# Altium project Phaser.PrjPCB (part 5 of 11)

## Sheet FPGA_Config.SchDoc: =DocumentName
size A4; DocumentNumber: 1; Revision: 0; SheetNumber: 1; SheetTotal: 1
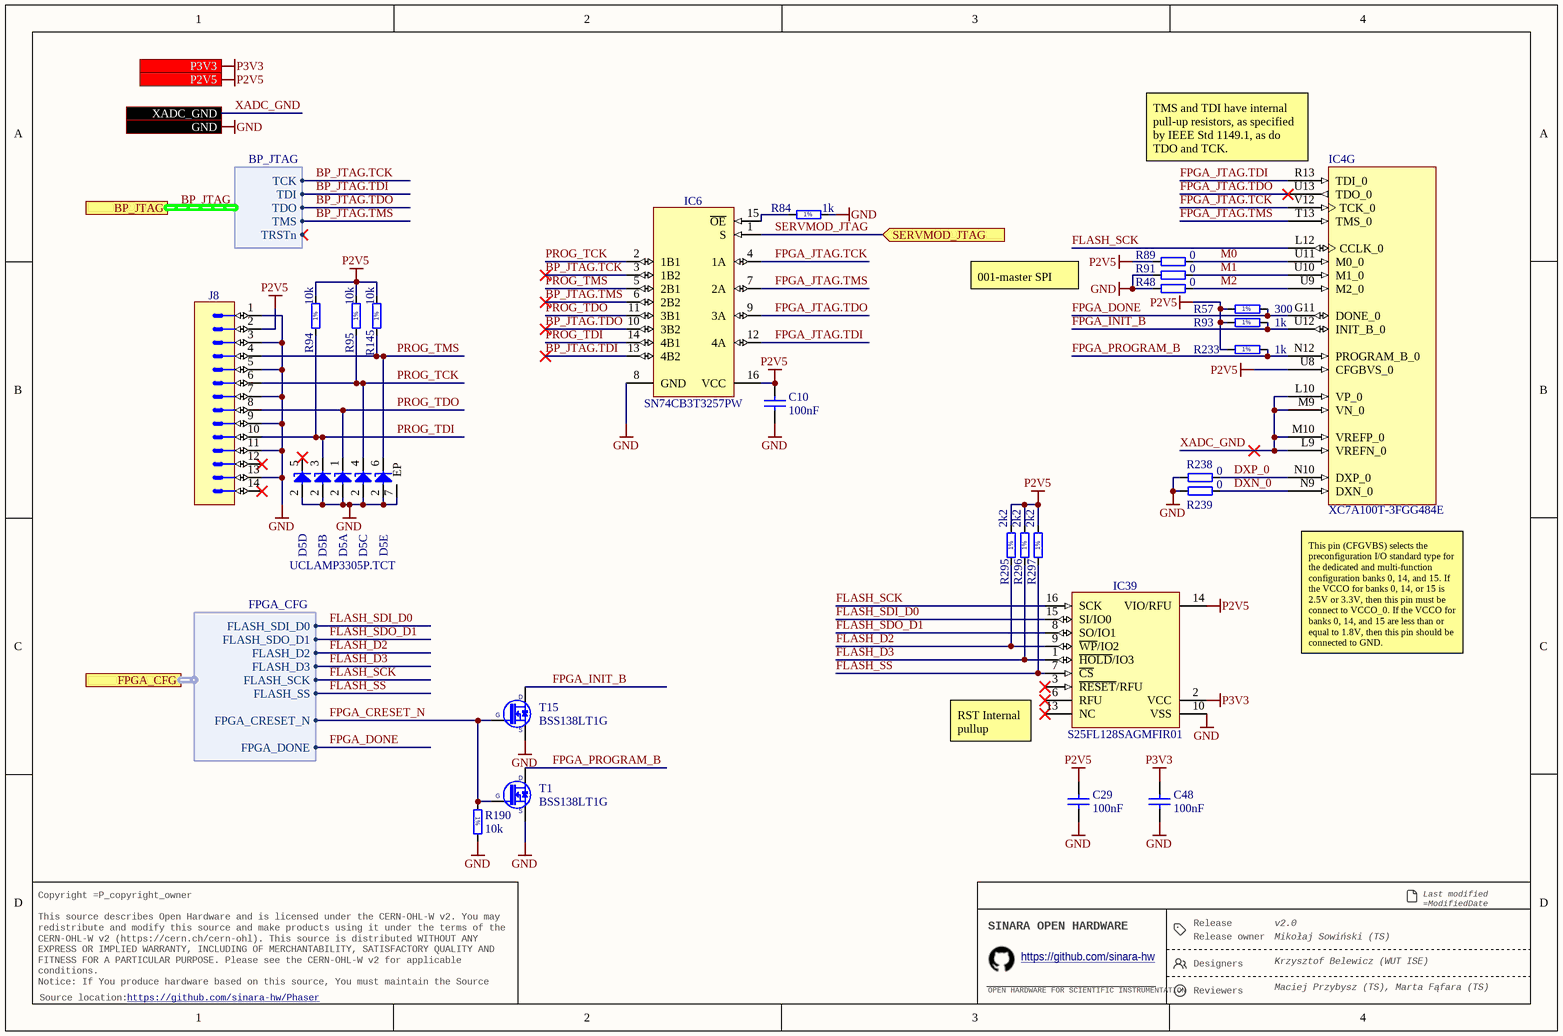
[diagram p14: FPGA_Config.SchDoc]

### Parts
(Parts that share a designator on the sheet are numbered #1, #2 ... from top to bottom, then left to right.)
C10  100nF  [CAPC1005X55N]
C29  100nF  [CAPC1005X55N]
C48  100nF  [CAPC1005X55N]
D5  UCLAMP3305P.TCT  [SON50P160X65_HS-7N]  (value not drawn)  (parts A,B,C,D,E of 5)
IC4#1  XC7A100T-3FGG484E  [FGG484]  (part G of 10)
IC6  SN74CB3T3257PW  [SOP65P640X120-16N]
IC39  S25FL128SAGMFIR01  [SOIC127P1030X265-16N]
J8  Milli-Grid™  [MOLEX_87832-1420]  (value not drawn)
R48  0  [RESC1005X40N]
R57  300  [RESC1005X40N]
R84  1k  [RESC1005X40N]
R89  0  [RESC1005X40N]
R91  0  [RESC1005X40N]
R93  1k  [RESC1005X40N]
R94  10k  [RESC1005X40N]
R95  10k  [RESC1005X40N]
R145  10k  [RESC1005X40N]
R190  10k  [RESC1005X40N]
R233  1k  [RESC1005X40N]
R238  0  [RESC1005X40N]
R239  0  [RESC1005X40N]
R295  2k2  [RESC1005X40N]
R296  2k2  [RESC1005X40N]
R297  2k2  [RESC1005X40N]
T1  BSS138LT1G  [SOT95P240X110-3N]
T15  BSS138LT1G  [SOT95P240X110-3N]

### Ports
BP_JTAG (harness BP_JTAG), FPGA_CFG (harness FPGA_CFG), GND, P2V5 (in), P3V3 (in), SERVMOD_JTAG (in), XADC_GND

### Harnesses
FPGA_CFG: FLASH_SDI_D0, FLASH_SDO_D1, FLASH_D2, FLASH_D3, FLASH_SCK, FLASH_SS, FPGA_CRESET_N, FPGA_DONE
BP_JTAG: TCK, TDI, TDO, TMS, TRSTn

### Nets
GND: C10.1 C29.1 C48.1 D5.2(A) D5.7(EP) IC6.8(GND) IC39.10(VSS) J8.1 J8.3 J8.5 J8.7 J8.9 J8.11 J8.13 R48.1 R84.2 R91.1 R190.2 R238.1 R239.1 T1.2(S) T15.2(S) ; port GND
P2V5: C10.2 C29.2 IC4#1.U8(CFGBVS_0) IC6.16(VCC) IC39.14(VIO/RFU) J8.2 R57.1 R89.1 R93.2 R94.2 R95.2 R145.2 R233.2 R295.2 R296.2 R297.2 ; port P2V5
P3V3: C48.2 IC39.2(VCC) ; port P3V3
BP_JTAG.TCK: IC6.3(1B2) ; port BP_JTAG.TCK
BP_JTAG.TDI: IC6.13(4B2) ; port BP_JTAG.TDI
BP_JTAG.TDO: IC6.10(3B2) ; port BP_JTAG.TDO
BP_JTAG.TMS: IC6.6(2B2) ; port BP_JTAG.TMS
DXN_0: IC4#1.N9(DXN_0) R239.2
DXP_0: IC4#1.N10(DXP_0) R238.2
FLASH_D2: IC39.9(~{WP}/IO2) R295.1 ; port FPGA_CFG.FLASH_D2  [project net FPGA_CFG.FLASH_D2]
FLASH_D3: IC39.1(~{HOLD}/IO3) R296.1 ; port FPGA_CFG.FLASH_D3  [project net FPGA_CFG.FLASH_D3]
FLASH_SCK: IC4#1.L12(CCLK_0) IC39.16(SCK) ; port FPGA_CFG.FLASH_SCK  [project net FPGA_CFG.FLASH_SCK]
FLASH_SDI_D0: IC39.15(SI/IO0) ; port FPGA_CFG.FLASH_SDI_D0  [project net FPGA_CFG.FLASH_SDI_D0]
FLASH_SDO_D1: IC39.8(SO/IO1) ; port FPGA_CFG.FLASH_SDO_D1  [project net FPGA_CFG.FLASH_SDO_D1]
FLASH_SS: IC39.7(~{CS}) R297.1 ; port FPGA_CFG.FLASH_SS  [project net FPGA_CFG.FLASH_SS]
FPGA_CRESET_N: R190.1 T1.1(G) T15.1(G) ; port FPGA_CFG.FPGA_CRESET_N  [project net FPGA_CFG.FPGA_CRESET_N]
FPGA_DONE: IC4#1.G11(DONE_0) R57.2 ; port FPGA_CFG.FPGA_DONE  [project net FPGA_CFG.FPGA_DONE]
FPGA_INIT_B: IC4#1.U12(INIT_B_0) R93.1 T15.3(D)
FPGA_JTAG.TCK: IC4#1.V12(TCK_0) IC6.4(1A)
FPGA_JTAG.TDI: IC4#1.R13(TDI_0) IC6.12(4A)
FPGA_JTAG.TDO: IC4#1.U13(TDO_0) IC6.9(3A)
FPGA_JTAG.TMS: IC4#1.T13(TMS_0) IC6.7(2A)
FPGA_PROGRAM_B: IC4#1.N12(PROGRAM_B_0) R233.1 T1.3(D)
M0: IC4#1.U11(M0_0) R89.2
M1: IC4#1.U10(M1_0) R91.2
M2: IC4#1.U9(M2_0) R48.2
PROG_TCK: D5.4(C) IC6.2(1B1) J8.6 R95.1
PROG_TDI: D5.3(C) IC6.14(4B1) J8.10 R94.1
PROG_TDO: D5.1(C) IC6.11(3B1) J8.8
PROG_TMS: D5.6(C) IC6.5(2B1) J8.4 R145.1
SERVMOD_JTAG: IC6.1(S) ; port SERVMOD_JTAG
XADC_GND: IC4#1.L9(VREFN_0) IC4#1.L10(VP_0) IC4#1.M9(VN_0) IC4#1.M10(VREFP_0) ; port XADC_GND
NetIC6_15: IC6.15(~{OE}) R84.1

Not connected (* = marked no-connect by the designer): D5 5(C)*; IC39 3(~{RESET}/RFU)* 6(RFU)* 13(NC)*; J8 12* 14*

### Buses and harness runs
harness BP_JTAG = port BP_JTAG

### Notes on the sheet
- (near IC4#1) TMS and TDI have internal pull-up resistors, as specified by IEEE Std 1149.1, as do TDO and TCK.
- 001-master SPI
- (near IC4#1) This pin (CFGVBS) selects the preconfiguration I/O standard type for the dedicated and multi-function configuration banks 0, 14, and 15. If the VCCO for banks 0, 14, or 15 is 2.5V or 3.3V, then this pin must be connect to VCCO_0. If the VCCO for banks 0, 14, and 15 are less than or equal to 1.8V, then this pin should be connected to GND.
- (near IC39) RST Internal pullup
- Release
- Last modified =ModifiedDate
  Sheet =sheetnumber of =sheettotal · Size A4
- Copyright =P_copyright_owner
  This source describes Open Hardware and is licensed under the CERN-OHL-W v2. You may redistribute and modify this source and make products using it under the terms of the CERN-OHL-W v2 (https://cern.ch/cern-ohl). This source is distributed WITHOUT ANY EXPRESS OR IMPLIED WARRANTY, INCLUDING OF MERCHANTABILITY, SATISFACTORY QUALITY AND FITNESS FOR A PARTICULAR PURPOSE. Please see the CERN-OHL-W v2 for applicable conditions.
  Notice: If You produce hardware based on this source, You must maintain the Source Location visible on the product, its packaging or its documentation.
- SINARA OPEN HARDWARE
- OPEN HARDWARE FOR SCIENTIFIC INSTRUMENTATION
- https://github.com/sinara-hw
- Release owner
- Designers
- Reviewers
- Source location:
- (in symbol R0402_1K_1%_0.0625W_100PPM) 1%
- (in symbol R0402_2K2_1%_0.0625W_100PPM) 1%
- (in symbol R0402_10K_1%_0.0625W_100PPM) 1%
- (in symbol R0402_300R_1%_0.0625W_100PPM) 1%

### Library data of the parts
C10 C29 C48 = CC0402_100NF_50V_10%_X7R: Non-polarised capacitor; Part Description: SMD Multilayer Chip Ceramic Capacitor; Manufacturer: GENERIC; Manufacturer1 Part Number: GRM155R71H104KE14D; Voltage: 50V; TC: X7R; Tolerance: ±10%; Part Number: CC0402_100NF_50V_10%_X7R; Component Kind: Standard; Component Type: Standard; Pin Count: 2; Value: 100nF; Status: None; Manufacturer Part Number: CC0402_100NF_50V_10%_X7R; Case: 0402; Mounted: Yes; Socket: No; SMD: Yes; Sense: No; Manufacturer1 Example: MURATA; Manufacturer1 ComponentHeight: 0.55mm; HelpURL: \\cern.ch\dfs\Applications\Altium\Datasheets\CC0402_MURATA_GRM155R71H104KE14D.pdf; Author: CERN DEM MR; CreateDate: 30.06.2017; LatestRevisionDate: 30.06.2017
D5 = CMP-004-00037-2: Diode TVS Quint Common Anode Uni-Dir 3.3V 40W 6-Pin SLP EP T/R; Max Operating Temperature: 125°C; Min Operating Temperature: -55°C; Pins: 6; Mounting Technology: Surface Mount
IC4#1 = CMP-0364-00028-3: Artix-7 FPGA, 285 User I/Os, 4 GTP, 484-Ball BGA, Speed Grade 3, Extended Grade, Pb-Free; Manufacturer: Xilinx; Max User I/O: 300; Clock Mgmt Tiles (CMTs): 6; Logic Cells: 101440; Block RAM Blocks (36Kb): 135; Block RAM Blocks (18Kb): 270; Speed Grade: -3; CLBs (Slices): 15850; Block RAM Blocks (Max Kb): 4860; DSP48E1 Slices: 240; RoHS: Pb-Free; ComponentLink3URL: http://www.xilinx.com/support/documentation/data_sheets/ds181_Artix_7_Data_Sheet.pdf; NexusDeviceID: XC7A100T-3FGG484E; DatasheetVersion: v1.12; Mounting Technology: Surface Mount; PackageDescription: Wire-Bond Fine-Pitch BGA, Body 23 x 23 mm, 1.0 mm Pitch; PackageReference: FGG484; ComponentLink2Description: Package Specification; Code_JEDEC: MS-034-AAJ-1; ComponentLink2URL: http://www.xilinx.com/support/documentation/user_guides/ug475_7Series_Pkg_Pinout.pdf; ComponentLink3Description: DC and Switching Characteristics; Generic Part Number: XC7A100T; ComponentLink4Description: Package File; ComponentLink4URL: http://www.xilinx.com/support/packagefiles/a7packages/xc7a100tfgg484pkg.txt; ComponentLink1URL: http://www.xilinx.com/support/documentation/data_sheets/ds180_7Series_Overview.pdf; PartNumber: XC7A100T-3FGG484E; ComponentLink5URL: http://www.xilinx.com/support/documentation/user_guides/ug475_7Series_Pkg_Pinout.pdf; PackageVersion: Rev 1.8; ComponentLink5Description: Packaging and Pinout; ComponentLink1Description: Datasheet; CLBs (Max Distributed RAM Kb): 1188
IC6 = SN74CB3T3257PW: 4-BIT 1-OF-2 FET Multiplexer/Demultiplexer 2.5V/3.3V Low-Voltage Bus Switch 5V Tolerant Shifter; Manufacturer: TEXAS INSTRUMENTS; PressFit: No; Bonding: No; Part Number: SN74CB3T3257PW; Component Kind: Standard; Component Type: Standard; Device: SN74CB3T3257PW; PackageDescription: SOP, 0.65mm Pitch; 16 Pin, 4.40mm W X 5.00mm L X 1.20mm H body, IPC Medium Density; Part Description: 4-Bit 1-of-2 FET Multiplexer/Demultiplexer 2.5V/3.3V Low-Voltage Bus Switch 5V Tolerant Shifter; Manufacturer Part Number: SN74CB3T3257PW; Pin Count: 16; Case: TSSOP16; Mounted: Yes; Socket: No; SMD: Yes; Sense: No; ComponentHeight: 1.2mm; Author: CERN DEM JLC; HelpURL: \\cern.ch\dfs\Applications\Altium\Datasheets\SN74CB3T3257PW.pdf; CreateDate: 2012-01-30; LatestRevisionDate: 2012-01-30
IC39 = S25FL128SAGMFIR01: 128Mbit, MirrorBit® Flash Non-Volatile Memory CMOS 3.0 Volt Core with Versatile I/O Serial Peripheral Interface with Multi-I/O; Part Description: 128Mbit, 133MHz, MirrorBit® Flash Non-Volatile Memory CMOS 3V Core with Versatile I/O Serial Peripheral Interface with Multi-I/O; Manufacturer: SPANSION; PressFit: No; Bonding: No; Part Number: S25FL128SAGMFIR01; Component Kind: Standard; Component Type: Standard; Device: S25FL128SAGMFIR01; PackageDescription: SOIC 16, Pitch 1.27mm - Body 7.5x10.3mm, IPC Medium Density; Manufacturer Part Number: S25FL128SAGMFIR01; Pin Count: 11; Case: SOIC16; Mounted: Yes; Socket: No; SMD: Yes; Sense: No; ComponentHeight: 2.65mm; HelpURL: \\cern.ch\dfs\Applications\Altium\Datasheets\S25FL128SAGMFIR01.pdf; Author: CERN DEM JLC; CreateDate: 2014-07-10; LatestRevisionDate: 2014-07-10
J8 = MOLEX_87832-1420: Connector 14 Male; Part Description: 2.00mm (.079") Pitch Milli-Grid™ Header, Surface Mount, Vertical, Shrouded, 14 Circuits,with Locking Windows and Centre Polarization Slot, PCB Locator; Manufacturer: MOLEX; PressFit: No; Part Number: MOLEX_87832-1420; Component Kind: Standard; Component Type: Standard; Pin Count: 14; Family: Milli-Grid™; Mounted: Yes; Socket: No; SMD: Yes; Sense: No; Status: None; Manufacturer Part Number: 87832-1420; ComponentHeight: 7.6mm; HelpURL: \\cern.ch\dfs\Applications\Altium\Datasheets\MOLEX_87832-1420.pdf; Author: CERN DEM JLC; CreateDate: 09.09.2008; LatestRevisionDate: 09.09.2008
R48 R89 R91 R238 R239 = R0402_0R_JUMPER: Resistor; Part Description: 1A (0.05R Max DC Resistance) Zero Ohm Jumper; Manufacturer: GENERIC; Manufacturer1 Part Number: 232270591001L; PressFit: No; Part Number: R0402_0R_JUMPER; Component Kind: Standard; Component Type: Standard; Pin Count: 2; Value: 0; Status: Not Recommended; Manufacturer Part Number: R0402_0R_JUMPER; Case: 0402; Mounted: Yes; Sense: No; Socket: No; SMD: Yes; Manufacturer1 Example: YAGEO PHYCOMP; Manufacturer1 ComponentHeight: 0.4mm; HelpURL: \\cern.ch\dfs\Applications\Altium\Datasheets\R0402_Phycomp_RC0402.pdf; Author: CERN DEM JLC; CreateDate: 03.12.2007; LatestRevisionDate: 17.10.2012; ClassName: Artix
R57 = R0402_300R_1%_0.0625W_100PPM: Resistor - 1%; Part Description: General Purpose Thick Film Chip Resistor; Manufacturer: GENERIC; Manufacturer1 Part Number: 232270673001L; TC: ±100ppm/°C; PressFit: No; Part Number: R0402_300R_1%_0.0625W_100PPM; Component Kind: Standard; Component Type: Standard; Pin Count: 2; Value: 300; Status: Not Recommended; Power: 0.0625W; Tolerance: ±1%; Manufacturer Part Number: R0402_300R_1%_0.0625W_100PPM; Case: 0402; Mounted: Yes; Sense: No; Socket: No; SMD: Yes; Manufacturer1 Example: YAGEO PHYCOMP; Manufacturer1 ComponentHeight: 0.4mm; HelpURL: \\cern.ch\dfs\Applications\Altium\Datasheets\R0402_Phycomp_RC0402.pdf; Author: CERN DEM JLC; CreateDate: 03.12.2007; LatestRevisionDate: 17.10.2012
R84 R93 R233 = R0402_1K_1%_0.0625W_100PPM: Resistor - 1%; Part Description: General Purpose Thick Film Chip Resistor; Manufacturer: GENERIC; Manufacturer1 Part Number: 232270671002L; TC: ±100ppm/°C; PressFit: No; Part Number: R0402_1K_1%_0.0625W_100PPM; Component Kind: Standard; Component Type: Standard; Pin Count: 2; Value: 1k; Status: Not Recommended; Power: 0.0625W; Tolerance: ±1%; Manufacturer Part Number: R0402_1K_1%_0.0625W_100PPM; Case: 0402; Mounted: Yes; Sense: No; Socket: No; SMD: Yes; Manufacturer1 Example: YAGEO PHYCOMP; Manufacturer1 ComponentHeight: 0.4mm; HelpURL: \\cern.ch\dfs\Applications\Altium\Datasheets\R0402_Phycomp_RC0402.pdf; Author: CERN DEM JLC
  R84: CreateDate: 2007-12-03; LatestRevisionDate: 2012-10-17
  R93 R233: CreateDate: 03.12.2007; LatestRevisionDate: 17.10.2012; ClassName: Artix
R94 R95 R145 = R0402_10K_1%_0.0625W_100PPM: Resistor - 1%; Part Description: General Purpose Thick Film Chip Resistor; Manufacturer: GENERIC; Manufacturer1 Part Number: 232270671003L; TC: ±100ppm/°C; PressFit: No; Part Number: R0402_10K_1%_0.0625W_100PPM; Component Kind: Standard; Component Type: Standard; Pin Count: 2; Value: 10k; Status: Not Recommended; Power: 0.0625W; Tolerance: ±1%; Manufacturer Part Number: R0402_10K_1%_0.0625W_100PPM; Case: 0402; Mounted: Yes; Sense: No; Socket: No; SMD: Yes; Manufacturer1 Example: YAGEO PHYCOMP; Manufacturer1 ComponentHeight: 0.4mm; HelpURL: \\cern.ch\dfs\Applications\Altium\Datasheets\R0402_Phycomp_RC0402.pdf; Author: CERN DEM JLC; CreateDate: 2007-12-03; LatestRevisionDate: 2012-10-17
R190 = R0402_10K_1%_0.0625W_100PPM: Resistor - 1%; Part Description: General Purpose Thick Film Chip Resistor; Manufacturer: GENERIC; Manufacturer1 Part Number: 232270671003L; TC: ±100ppm/°C; Table: Resistors SMD; Part Number: R0402_10K_1%_0.0625W_100PPM; Component Kind: Standard; Component Type: Standard; Pin Count: 2; Value: 10k; Status: Not recommended; Power: 0.0625W; Tolerance: ±1%; Manufacturer Part Number: R0402_10K_1%_0.0625W_100PPM; Case: 0402; Mounted: Yes; Socket: No; SMD: Yes; Manufacturer1 Example: YAGEO PHYCOMP; Manufacturer1 ComponentHeight: 0.4mm; HelpURL: \\cern.ch\dfs\Applications\Altium\Datasheets\R0402_Phycomp_RC0402.pdf; Author: CERN DEM JLC; CreateDate: 2007-12-03; LatestRevisionDate: 2012-10-17
R295-R297 = R0402_2K2_1%_0.0625W_100PPM: Resistor - 1%; Part Description: General Purpose Thick Film Chip Resistor; Manufacturer: GENERIC; Manufacturer1 Part Number: 232270672202L; TC: ±100ppm/°C; PressFit: No; Part Number: R0402_2K2_1%_0.0625W_100PPM; Component Kind: Standard; Component Type: Standard; Pin Count: 2; Value: 2k2; Status: Not Recommended; Power: 0.0625W; Tolerance: ±1%; Manufacturer Part Number: R0402_2K2_1%_0.0625W_100PPM; Case: 0402; Mounted: Yes; Sense: No; Socket: No; SMD: Yes; Manufacturer1 Example: YAGEO PHYCOMP; Manufacturer1 ComponentHeight: 0.4mm; HelpURL: \\cern.ch\dfs\Applications\Altium\Datasheets\R0402_Phycomp_RC0402.pdf; Author: CERN DEM JLC; CreateDate: 03.12.2007; LatestRevisionDate: 17.10.2012; ClassName: Artix
T1 T15 = BSS138LT1G: N-CHANNEL MOSFET WITH DIODE; Part Description: 50V 200mA N-Channel Enhancement Mode Field-Effect Transistor; Manufacturer: ON SEMICONDUCTOR; PressFit: No; Bonding: No; Part Number: BSS138LT1G; Component Kind: Standard; Component Type: Standard; Device: BSS138LT1G; PackageDescription: SOT23 3-Leads, Pitch 0.95mm - Body 1.4x3mm, IPC Medium Density; Manufacturer Part Number: BSS138LT1G; Pin Count: 3; Case: SOT23-3; Mounted: Yes; Socket: No; SMD: Yes; Sense: No; ComponentHeight: 1.11mm; HelpURL: \\cern.ch\dfs\Applications\Altium\Datasheets\BSS138LT1G.pdf; Author: CERN DEM JLC; CreateDate: 23.03.2009; LatestRevisionDate: 23.03.2009

## Sheet FPGA_Bank34.SchDoc: =DocumentName
size A3; DocumentNumber: 1; Revision: 0; SheetNumber: 1; SheetTotal: 1
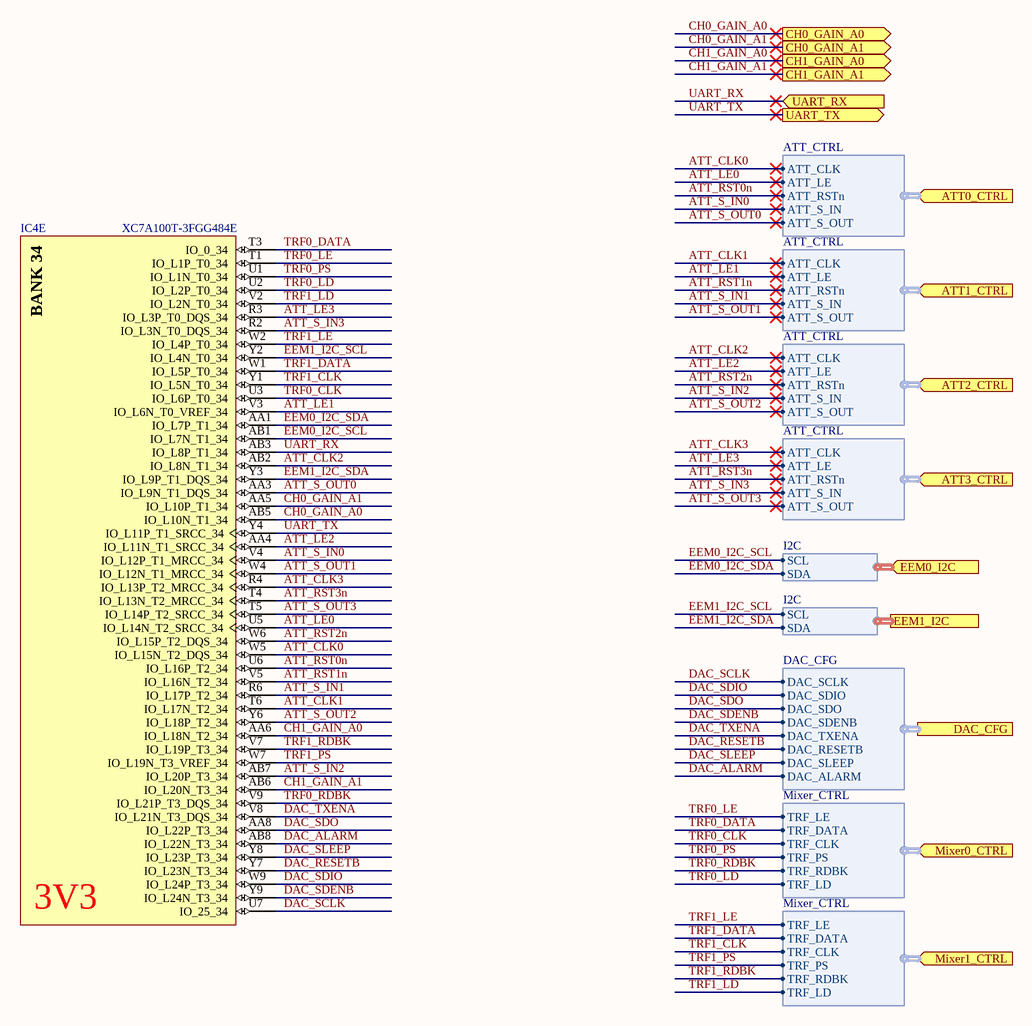
[diagram p15: FPGA_Bank34.SchDoc]

### Parts
(Parts that share a designator on the sheet are numbered #1, #2 ... from top to bottom, then left to right.)
IC4#1  XC7A100T-3FGG484E  [FGG484]  (part E of 10)

### Ports
ATT0_CTRL (in, harness ATT_CTRL), ATT1_CTRL (in, harness ATT_CTRL), ATT2_CTRL (in, harness ATT_CTRL), ATT3_CTRL (in, harness ATT_CTRL), CH0_GAIN_A0 (out), CH0_GAIN_A1 (out), CH1_GAIN_A0 (out), CH1_GAIN_A1 (out), DAC_CFG (harness DAC_CFG), EEM0_I2C (in, harness I2C), EEM1_I2C (harness I2C), Mixer0_CTRL (in, harness Mixer_CTRL), Mixer1_CTRL (in, harness Mixer_CTRL), UART_RX (in), UART_TX (out)

### Harnesses
I2C: SDA, SCL
DAC_CFG: DAC_SCLK, DAC_SDIO, DAC_SDO, DAC_SDENB, DAC_TXENA, DAC_RESETB, DAC_SLEEP, DAC_ALARM
Mixer_CTRL: TRF_LE, TRF_DATA, TRF_CLK, TRF_PS, TRF_RDBK, TRF_LD
ATT_CTRL: ATT_CLK, ATT_LE, ATT_RSTn, ATT_S_IN, ATT_S_OUT

### Nets
ATT_CLK0: IC4#1.W5(IO_L15N_T2_DQS_34) ; port ATT0_CTRL.ATT_CLK
ATT_CLK1: IC4#1.T6(IO_L17N_T2_34) ; port ATT1_CTRL.ATT_CLK
ATT_CLK2: IC4#1.AB2(IO_L8N_T1_34) ; port ATT2_CTRL.ATT_CLK
ATT_CLK3: IC4#1.R4(IO_L13P_T2_MRCC_34) ; port ATT3_CTRL.ATT_CLK
ATT_LE0: IC4#1.U5(IO_L14N_T2_SRCC_34) ; port ATT0_CTRL.ATT_LE
ATT_LE1: IC4#1.V3(IO_L6N_T0_VREF_34) ; port ATT1_CTRL.ATT_LE
ATT_LE2: IC4#1.AA4(IO_L11N_T1_SRCC_34) ; port ATT2_CTRL.ATT_LE
ATT_LE3: IC4#1.R3(IO_L3P_T0_DQS_34) ; port ATT3_CTRL.ATT_LE
ATT_RST0n: IC4#1.U6(IO_L16P_T2_34) ; port ATT0_CTRL.ATT_RSTn
ATT_RST1n: IC4#1.V5(IO_L16N_T2_34) ; port ATT1_CTRL.ATT_RSTn
ATT_RST2n: IC4#1.W6(IO_L15P_T2_DQS_34) ; port ATT2_CTRL.ATT_RSTn
ATT_RST3n: IC4#1.T4(IO_L13N_T2_MRCC_34) ; port ATT3_CTRL.ATT_RSTn
ATT_S_IN0: IC4#1.V4(IO_L12P_T1_MRCC_34) ; port ATT0_CTRL.ATT_S_IN
ATT_S_IN1: IC4#1.R6(IO_L17P_T2_34) ; port ATT1_CTRL.ATT_S_IN
ATT_S_IN2: IC4#1.AB7(IO_L20P_T3_34) ; port ATT2_CTRL.ATT_S_IN
ATT_S_IN3: IC4#1.R2(IO_L3N_T0_DQS_34) ; port ATT3_CTRL.ATT_S_IN
ATT_S_OUT0: IC4#1.AA3(IO_L9N_T1_DQS_34) ; port ATT0_CTRL.ATT_S_OUT
ATT_S_OUT1: IC4#1.W4(IO_L12N_T1_MRCC_34) ; port ATT1_CTRL.ATT_S_OUT
ATT_S_OUT2: IC4#1.Y6(IO_L18P_T2_34) ; port ATT2_CTRL.ATT_S_OUT
ATT_S_OUT3: IC4#1.T5(IO_L14P_T2_SRCC_34) ; port ATT3_CTRL.ATT_S_OUT
CH0_GAIN_A0: IC4#1.AB5(IO_L10N_T1_34) ; port CH0_GAIN_A0
CH0_GAIN_A1: IC4#1.AA5(IO_L10P_T1_34) ; port CH0_GAIN_A1
CH1_GAIN_A0: IC4#1.AA6(IO_L18N_T2_34) ; port CH1_GAIN_A0
CH1_GAIN_A1: IC4#1.AB6(IO_L20N_T3_34) ; port CH1_GAIN_A1
DAC_ALARM: IC4#1.AB8(IO_L22N_T3_34) ; port DAC_CFG.DAC_ALARM
DAC_RESETB: IC4#1.Y7(IO_L23N_T3_34) ; port DAC_CFG.DAC_RESETB
DAC_SCLK: IC4#1.U7(IO_25_34) ; port DAC_CFG.DAC_SCLK
DAC_SDENB: IC4#1.Y9(IO_L24N_T3_34) ; port DAC_CFG.DAC_SDENB
DAC_SDIO: IC4#1.W9(IO_L24P_T3_34) ; port DAC_CFG.DAC_SDIO
DAC_SDO: IC4#1.AA8(IO_L22P_T3_34) ; port DAC_CFG.DAC_SDO
DAC_SLEEP: IC4#1.Y8(IO_L23P_T3_34) ; port DAC_CFG.DAC_SLEEP
DAC_TXENA: IC4#1.V8(IO_L21N_T3_DQS_34) ; port DAC_CFG.DAC_TXENA
EEM0_I2C_SCL: IC4#1.AB1(IO_L7N_T1_34) ; port EEM0_I2C.SCL  [project net EEM0_INT_I2C.SCL]
EEM0_I2C_SDA: IC4#1.AA1(IO_L7P_T1_34) ; port EEM0_I2C.SDA  [project net EEM0_INT_I2C.SDA]
EEM1_I2C_SCL: IC4#1.Y2(IO_L4N_T0_34) ; port EEM1_I2C.SCL  [project net EEM1_INT_I2C.SCL]
EEM1_I2C_SDA: IC4#1.Y3(IO_L9P_T1_DQS_34) ; port EEM1_I2C.SDA  [project net EEM1_INT_I2C.SDA]
TRF0_CLK: IC4#1.U3(IO_L6P_T0_34) ; port Mixer0_CTRL.TRF_CLK  [project net TRF_CLK]
TRF0_DATA: IC4#1.T3(IO_0_34) ; port Mixer0_CTRL.TRF_DATA  [project net TRF_DATA]
TRF0_LD: IC4#1.U2(IO_L2P_T0_34) ; port Mixer0_CTRL.TRF_LD  [project net TRF_LD]
TRF0_LE: IC4#1.T1(IO_L1P_T0_34) ; port Mixer0_CTRL.TRF_LE  [project net TRF_LE]
TRF0_PS: IC4#1.U1(IO_L1N_T0_34) ; port Mixer0_CTRL.TRF_PS  [project net TRF_PS]
TRF0_RDBK: IC4#1.V9(IO_L21P_T3_DQS_34) ; port Mixer0_CTRL.TRF_RDBK  [project net TRF_RDBK]
TRF1_CLK: IC4#1.Y1(IO_L5N_T0_34) ; port Mixer1_CTRL.TRF_CLK  [project net TRF_CLK]
TRF1_DATA: IC4#1.W1(IO_L5P_T0_34) ; port Mixer1_CTRL.TRF_DATA  [project net TRF_DATA]
TRF1_LD: IC4#1.V2(IO_L2N_T0_34) ; port Mixer1_CTRL.TRF_LD  [project net TRF_LD]
TRF1_LE: IC4#1.W2(IO_L4P_T0_34) ; port Mixer1_CTRL.TRF_LE  [project net TRF_LE]
TRF1_PS: IC4#1.W7(IO_L19N_T3_VREF_34) ; port Mixer1_CTRL.TRF_PS  [project net TRF_PS]
TRF1_RDBK: IC4#1.V7(IO_L19P_T3_34) ; port Mixer1_CTRL.TRF_RDBK  [project net TRF_RDBK]
UART_RX: IC4#1.AB3(IO_L8P_T1_34) ; port UART_RX
UART_TX: IC4#1.Y4(IO_L11P_T1_SRCC_34) ; port UART_TX

### Notes on the sheet
- 3V3
- Release
- Last modified =ModifiedDate
  Sheet =sheetnumber of =sheettotal · Size A3
- Copyright =P_copyright_owner
  This source describes Open Hardware and is licensed under the CERN-OHL-W v2. You may redistribute and modify this source and make products using it under the terms of the CERN-OHL-W v2 (https://cern.ch/cern-ohl). This source is distributed WITHOUT ANY EXPRESS OR IMPLIED WARRANTY, INCLUDING OF MERCHANTABILITY, SATISFACTORY QUALITY AND FITNESS FOR A PARTICULAR PURPOSE. Please see the CERN-OHL-W v2 for applicable conditions.
  Notice: If You produce hardware based on this source, You must maintain the Source Location visible on the product, its packaging or its documentation.
- SINARA OPEN HARDWARE
- OPEN HARDWARE FOR SCIENTIFIC INSTRUMENTATION
- https://github.com/sinara-hw
- Release owner
- Designers
- Reviewers
- Source location:
- (in symbol CMP-0364-00028-3, part E) BANK 34

### Library data of the parts
IC4#1 = CMP-0364-00028-3: as IC4#1 on sheet FPGA_Config; RoHS: Pb-Free; ComponentLink3URL: http://www.xilinx.com/support/documentation/data_sheets/ds181_Artix_7_Data_Sheet.pdf; NexusDeviceID: XC7A100T-3FGG484E; DatasheetVersion: v1.12; Mounting Technology: Surface Mount; PackageDescription: Wire-Bond Fine-Pitch BGA, Body 23 x 23 mm, 1.0 mm Pitch; PackageReference: FGG484; ComponentLink2Description: Package Specification; Code_JEDEC: MS-034-AAJ-1; ComponentLink2URL: http://www.xilinx.com/support/documentation/user_guides/ug475_7Series_Pkg_Pinout.pdf; ComponentLink3Description: DC and Switching Characteristics; Generic Part Number: XC7A100T; ComponentLink4Description: Package File; ComponentLink4URL: http://www.xilinx.com/support/packagefiles/a7packages/xc7a100tfgg484pkg.txt; ComponentLink1URL: http://www.xilinx.com/support/documentation/data_sheets/ds180_7Series_Overview.pdf; PartNumber: XC7A100T-3FGG484E; ComponentLink5URL: http://www.xilinx.com/support/documentation/user_guides/ug475_7Series_Pkg_Pinout.pdf; PackageVersion: Rev 1.8; ComponentLink5Description: Packaging and Pinout; ComponentLink1Description: Datasheet; CLBs (Max Distributed RAM Kb): 1188

## Sheet FPGA_Bank15-16.SchDoc: =DocumentName
size A3; DocumentNumber: 1; Revision: 0; SheetNumber: 1; SheetTotal: 1
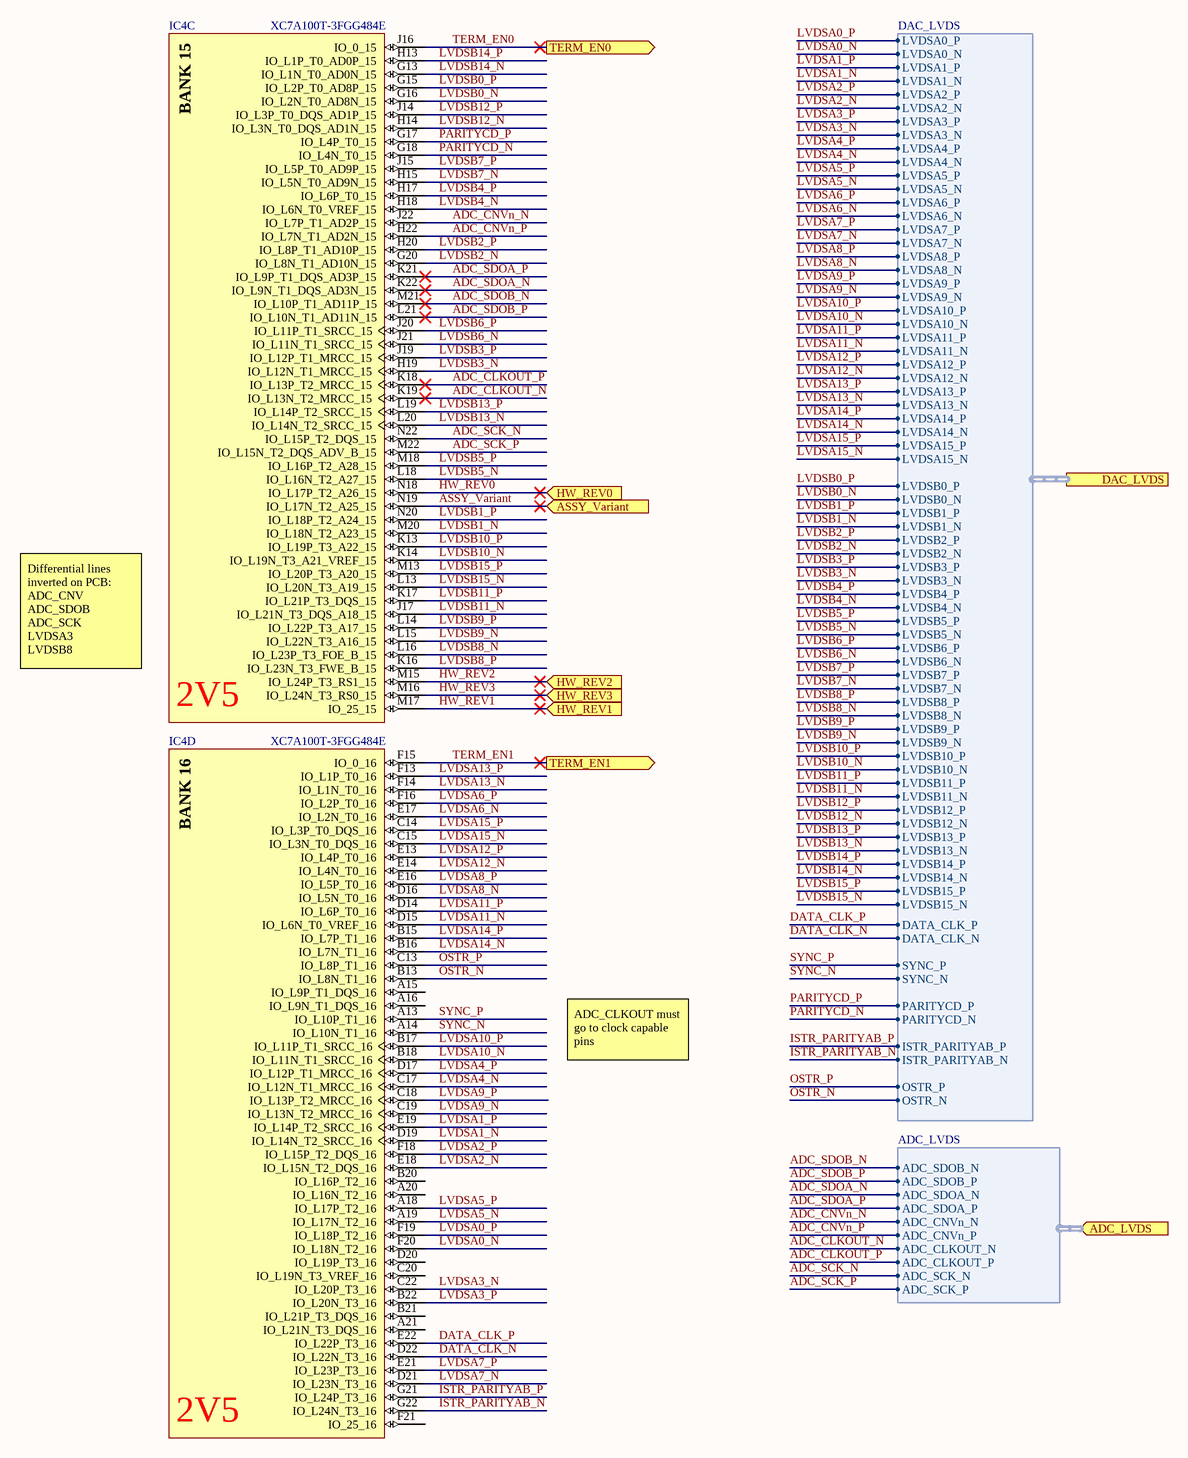
[diagram p16: FPGA_Bank15-16.SchDoc]

### Parts
(Parts that share a designator on the sheet are numbered #1, #2 ... from top to bottom, then left to right.)
IC4#1  XC7A100T-3FGG484E  [FGG484]  (parts C,D of 10)

### Ports
ADC_LVDS (in, harness ADC_LVDS), ASSY_Variant (in), DAC_LVDS (harness DAC_LVDS), HW_REV0 (in), HW_REV1 (in), HW_REV2 (in), HW_REV3 (in), TERM_EN0 (out), TERM_EN1 (out)

### Harnesses
DAC_LVDS: LVDSA0_P, LVDSA0_N, LVDSA1_P, LVDSA1_N, LVDSA2_P, LVDSA2_N, LVDSA3_P, LVDSA3_N, LVDSA4_P, LVDSA4_N, LVDSA5_P, LVDSA5_N, LVDSA6_P, LVDSA6_N, LVDSA7_P, LVDSA7_N, LVDSA8_P, LVDSA8_N, LVDSA9_P, LVDSA9_N, LVDSA10_P, LVDSA10_N, LVDSA11_P, LVDSA11_N, LVDSA12_P, LVDSA12_N, LVDSA13_P, LVDSA13_N, LVDSA14_P, LVDSA14_N, LVDSA15_P, LVDSA15_N, LVDSB0_P, LVDSB0_N, LVDSB1_P, LVDSB1_N, LVDSB2_P, LVDSB2_N, LVDSB3_P, LVDSB3_N, LVDSB4_P, LVDSB4_N, LVDSB5_P, LVDSB5_N, LVDSB6_P, LVDSB6_N, LVDSB7_P, LVDSB7_N, LVDSB8_P, LVDSB8_N, LVDSB9_P, LVDSB9_N, LVDSB10_P, LVDSB10_N, LVDSB11_P, LVDSB11_N, LVDSB12_P, LVDSB12_N, LVDSB13_P, LVDSB13_N, LVDSB14_P, LVDSB14_N, LVDSB15_P, LVDSB15_N, DATA_CLK_P, DATA_CLK_N, SYNC_P, SYNC_N, PARITYCD_P, PARITYCD_N, ISTR_PARITYAB_P, ISTR_PARITYAB_N, OSTR_P, OSTR_N
ADC_LVDS: ADC_SDOB_N, ADC_SDOB_P, ADC_SDOA_N, ADC_SDOA_P, ADC_CNVn_N, ADC_CNVn_P, ADC_CLKOUT_N, ADC_CLKOUT_P, ADC_SCK_N, ADC_SCK_P

### Nets
ADC_CLKOUT_N: IC4#1.K19(IO_L13N_T2_MRCC_15) ; port ADC_LVDS.ADC_CLKOUT_N
ADC_CLKOUT_P: IC4#1.K18(IO_L13P_T2_MRCC_15) ; port ADC_LVDS.ADC_CLKOUT_P
ADC_CNVn_N: IC4#1.J22(IO_L7P_T1_AD2P_15) ; port ADC_LVDS.ADC_CNVn_N
ADC_CNVn_P: IC4#1.H22(IO_L7N_T1_AD2N_15) ; port ADC_LVDS.ADC_CNVn_P
ADC_SCK_N: IC4#1.N22(IO_L15P_T2_DQS_15) ; port ADC_LVDS.ADC_SCK_N
ADC_SCK_P: IC4#1.M22(IO_L15N_T2_DQS_ADV_B_15) ; port ADC_LVDS.ADC_SCK_P
ADC_SDOA_N: IC4#1.K22(IO_L9N_T1_DQS_AD3N_15) ; port ADC_LVDS.ADC_SDOA_N
ADC_SDOA_P: IC4#1.K21(IO_L9P_T1_DQS_AD3P_15) ; port ADC_LVDS.ADC_SDOA_P
ADC_SDOB_N: IC4#1.M21(IO_L10P_T1_AD11P_15) ; port ADC_LVDS.ADC_SDOB_N
ADC_SDOB_P: IC4#1.L21(IO_L10N_T1_AD11N_15) ; port ADC_LVDS.ADC_SDOB_P
ASSY_Variant: IC4#1.N19(IO_L17N_T2_A25_15) ; port ASSY_Variant
DATA_CLK_N: IC4#1.D22(IO_L22N_T3_16) ; port DAC_LVDS.DATA_CLK_N
DATA_CLK_P: IC4#1.E22(IO_L22P_T3_16) ; port DAC_LVDS.DATA_CLK_P
HW_REV0: IC4#1.N18(IO_L17P_T2_A26_15) ; port HW_REV0
HW_REV1: IC4#1.M17(IO_25_15) ; port HW_REV1
HW_REV2: IC4#1.M15(IO_L24P_T3_RS1_15) ; port HW_REV2
HW_REV3: IC4#1.M16(IO_L24N_T3_RS0_15) ; port HW_REV3
ISTR_PARITYAB_N: IC4#1.G22(IO_L24N_T3_16) ; port DAC_LVDS.ISTR_PARITYAB_N
ISTR_PARITYAB_P: IC4#1.G21(IO_L24P_T3_16) ; port DAC_LVDS.ISTR_PARITYAB_P
LVDSA0_N: IC4#1.F20(IO_L18N_T2_16) ; port DAC_LVDS.LVDSA0_N
LVDSA0_P: IC4#1.F19(IO_L18P_T2_16) ; port DAC_LVDS.LVDSA0_P
LVDSA1_N: IC4#1.D19(IO_L14N_T2_SRCC_16) ; port DAC_LVDS.LVDSA1_N
LVDSA1_P: IC4#1.E19(IO_L14P_T2_SRCC_16) ; port DAC_LVDS.LVDSA1_P
LVDSA2_N: IC4#1.E18(IO_L15N_T2_DQS_16) ; port DAC_LVDS.LVDSA2_N
LVDSA2_P: IC4#1.F18(IO_L15P_T2_DQS_16) ; port DAC_LVDS.LVDSA2_P
LVDSA3_N: IC4#1.C22(IO_L20P_T3_16) ; port DAC_LVDS.LVDSA3_N
LVDSA3_P: IC4#1.B22(IO_L20N_T3_16) ; port DAC_LVDS.LVDSA3_P
LVDSA4_N: IC4#1.C17(IO_L12N_T1_MRCC_16) ; port DAC_LVDS.LVDSA4_N
LVDSA4_P: IC4#1.D17(IO_L12P_T1_MRCC_16) ; port DAC_LVDS.LVDSA4_P
LVDSA5_N: IC4#1.A19(IO_L17N_T2_16) ; port DAC_LVDS.LVDSA5_N
LVDSA5_P: IC4#1.A18(IO_L17P_T2_16) ; port DAC_LVDS.LVDSA5_P
LVDSA6_N: IC4#1.E17(IO_L2N_T0_16) ; port DAC_LVDS.LVDSA6_N
LVDSA6_P: IC4#1.F16(IO_L2P_T0_16) ; port DAC_LVDS.LVDSA6_P
LVDSA7_N: IC4#1.D21(IO_L23N_T3_16) ; port DAC_LVDS.LVDSA7_N
LVDSA7_P: IC4#1.E21(IO_L23P_T3_16) ; port DAC_LVDS.LVDSA7_P
LVDSA8_N: IC4#1.D16(IO_L5N_T0_16) ; port DAC_LVDS.LVDSA8_N
LVDSA8_P: IC4#1.E16(IO_L5P_T0_16) ; port DAC_LVDS.LVDSA8_P
LVDSA9_N: IC4#1.C19(IO_L13N_T2_MRCC_16) ; port DAC_LVDS.LVDSA9_N
LVDSA9_P: IC4#1.C18(IO_L13P_T2_MRCC_16) ; port DAC_LVDS.LVDSA9_P
LVDSA10_N: IC4#1.B18(IO_L11N_T1_SRCC_16) ; port DAC_LVDS.LVDSA10_N
LVDSA10_P: IC4#1.B17(IO_L11P_T1_SRCC_16) ; port DAC_LVDS.LVDSA10_P
LVDSA11_N: IC4#1.D15(IO_L6N_T0_VREF_16) ; port DAC_LVDS.LVDSA11_N
LVDSA11_P: IC4#1.D14(IO_L6P_T0_16) ; port DAC_LVDS.LVDSA11_P
LVDSA12_N: IC4#1.E14(IO_L4N_T0_16) ; port DAC_LVDS.LVDSA12_N
LVDSA12_P: IC4#1.E13(IO_L4P_T0_16) ; port DAC_LVDS.LVDSA12_P
LVDSA13_N: IC4#1.F14(IO_L1N_T0_16) ; port DAC_LVDS.LVDSA13_N
LVDSA13_P: IC4#1.F13(IO_L1P_T0_16) ; port DAC_LVDS.LVDSA13_P
LVDSA14_N: IC4#1.B16(IO_L7N_T1_16) ; port DAC_LVDS.LVDSA14_N
LVDSA14_P: IC4#1.B15(IO_L7P_T1_16) ; port DAC_LVDS.LVDSA14_P
LVDSA15_N: IC4#1.C15(IO_L3N_T0_DQS_16) ; port DAC_LVDS.LVDSA15_N
LVDSA15_P: IC4#1.C14(IO_L3P_T0_DQS_16) ; port DAC_LVDS.LVDSA15_P
LVDSB0_N: IC4#1.G16(IO_L2N_T0_AD8N_15) ; port DAC_LVDS.LVDSB0_N
LVDSB0_P: IC4#1.G15(IO_L2P_T0_AD8P_15) ; port DAC_LVDS.LVDSB0_P
LVDSB1_N: IC4#1.M20(IO_L18N_T2_A23_15) ; port DAC_LVDS.LVDSB1_N
LVDSB1_P: IC4#1.N20(IO_L18P_T2_A24_15) ; port DAC_LVDS.LVDSB1_P
LVDSB2_N: IC4#1.G20(IO_L8N_T1_AD10N_15) ; port DAC_LVDS.LVDSB2_N
LVDSB2_P: IC4#1.H20(IO_L8P_T1_AD10P_15) ; port DAC_LVDS.LVDSB2_P
LVDSB3_N: IC4#1.H19(IO_L12N_T1_MRCC_15) ; port DAC_LVDS.LVDSB3_N
LVDSB3_P: IC4#1.J19(IO_L12P_T1_MRCC_15) ; port DAC_LVDS.LVDSB3_P
LVDSB4_N: IC4#1.H18(IO_L6N_T0_VREF_15) ; port DAC_LVDS.LVDSB4_N
LVDSB4_P: IC4#1.H17(IO_L6P_T0_15) ; port DAC_LVDS.LVDSB4_P
LVDSB5_N: IC4#1.L18(IO_L16N_T2_A27_15) ; port DAC_LVDS.LVDSB5_N
LVDSB5_P: IC4#1.M18(IO_L16P_T2_A28_15) ; port DAC_LVDS.LVDSB5_P
LVDSB6_N: IC4#1.J21(IO_L11N_T1_SRCC_15) ; port DAC_LVDS.LVDSB6_N
LVDSB6_P: IC4#1.J20(IO_L11P_T1_SRCC_15) ; port DAC_LVDS.LVDSB6_P
LVDSB7_N: IC4#1.H15(IO_L5N_T0_AD9N_15) ; port DAC_LVDS.LVDSB7_N
LVDSB7_P: IC4#1.J15(IO_L5P_T0_AD9P_15) ; port DAC_LVDS.LVDSB7_P
LVDSB8_N: IC4#1.L16(IO_L23P_T3_FOE_B_15) ; port DAC_LVDS.LVDSB8_N
LVDSB8_P: IC4#1.K16(IO_L23N_T3_FWE_B_15) ; port DAC_LVDS.LVDSB8_P
LVDSB9_N: IC4#1.L15(IO_L22N_T3_A16_15) ; port DAC_LVDS.LVDSB9_N
LVDSB9_P: IC4#1.L14(IO_L22P_T3_A17_15) ; port DAC_LVDS.LVDSB9_P
LVDSB10_N: IC4#1.K14(IO_L19N_T3_A21_VREF_15) ; port DAC_LVDS.LVDSB10_N
LVDSB10_P: IC4#1.K13(IO_L19P_T3_A22_15) ; port DAC_LVDS.LVDSB10_P
LVDSB11_N: IC4#1.J17(IO_L21N_T3_DQS_A18_15) ; port DAC_LVDS.LVDSB11_N
LVDSB11_P: IC4#1.K17(IO_L21P_T3_DQS_15) ; port DAC_LVDS.LVDSB11_P
LVDSB12_N: IC4#1.H14(IO_L3N_T0_DQS_AD1N_15) ; port DAC_LVDS.LVDSB12_N
LVDSB12_P: IC4#1.J14(IO_L3P_T0_DQS_AD1P_15) ; port DAC_LVDS.LVDSB12_P
LVDSB13_N: IC4#1.L20(IO_L14N_T2_SRCC_15) ; port DAC_LVDS.LVDSB13_N
LVDSB13_P: IC4#1.L19(IO_L14P_T2_SRCC_15) ; port DAC_LVDS.LVDSB13_P
LVDSB14_N: IC4#1.G13(IO_L1N_T0_AD0N_15) ; port DAC_LVDS.LVDSB14_N
LVDSB14_P: IC4#1.H13(IO_L1P_T0_AD0P_15) ; port DAC_LVDS.LVDSB14_P
LVDSB15_N: IC4#1.L13(IO_L20N_T3_A19_15) ; port DAC_LVDS.LVDSB15_N
LVDSB15_P: IC4#1.M13(IO_L20P_T3_A20_15) ; port DAC_LVDS.LVDSB15_P
OSTR_N: IC4#1.B13(IO_L8N_T1_16) ; port DAC_LVDS.OSTR_N
OSTR_P: IC4#1.C13(IO_L8P_T1_16) ; port DAC_LVDS.OSTR_P
PARITYCD_N: IC4#1.G18(IO_L4N_T0_15) ; port DAC_LVDS.PARITYCD_N
PARITYCD_P: IC4#1.G17(IO_L4P_T0_15) ; port DAC_LVDS.PARITYCD_P
SYNC_N: IC4#1.A14(IO_L10N_T1_16) ; port DAC_LVDS.SYNC_N
SYNC_P: IC4#1.A13(IO_L10P_T1_16) ; port DAC_LVDS.SYNC_P
TERM_EN0: IC4#1.J16(IO_0_15) ; port TERM_EN0
TERM_EN1: IC4#1.F15(IO_0_16) ; port TERM_EN1

Not connected (* = marked no-connect by the designer): IC4#1 A15(IO_L9P_T1_DQS_16) A16(IO_L9N_T1_DQS_16) A20(IO_L16N_T2_16) A21(IO_L21N_T3_DQS_16) B20(IO_L16P_T2_16) B21(IO_L21P_T3_DQS_16) C20(IO_L19N_T3_VREF_16) D20(IO_L19P_T3_16) F21(IO_25_16)

### Notes on the sheet
- Differential lines inverted on PCB:
  ADC_CNV
  ADC_SDOB
  ADC_SCK
  LVDSA3
  LVDSB8
- 2V5
- ADC_CLKOUT must go to clock capable pins
- Release
- Last modified =ModifiedDate
  Sheet =sheetnumber of =sheettotal · Size A3
- Copyright =P_copyright_owner
  This source describes Open Hardware and is licensed under the CERN-OHL-W v2. You may redistribute and modify this source and make products using it under the terms of the CERN-OHL-W v2 (https://cern.ch/cern-ohl). This source is distributed WITHOUT ANY EXPRESS OR IMPLIED WARRANTY, INCLUDING OF MERCHANTABILITY, SATISFACTORY QUALITY AND FITNESS FOR A PARTICULAR PURPOSE. Please see the CERN-OHL-W v2 for applicable conditions.
  Notice: If You produce hardware based on this source, You must maintain the Source Location visible on the product, its packaging or its documentation.
- SINARA OPEN HARDWARE
- OPEN HARDWARE FOR SCIENTIFIC INSTRUMENTATION
- https://github.com/sinara-hw
- Release owner
- Designers
- Reviewers
- Source location:
- (in symbol CMP-0364-00028-3, part C) BANK 15
- (in symbol CMP-0364-00028-3, part D) BANK 16

### Library data of the parts
IC4#1 = CMP-0364-00028-3: as IC4#1 on sheet FPGA_Config; RoHS: Pb-Free; ComponentLink3URL: http://www.xilinx.com/support/documentation/data_sheets/ds181_Artix_7_Data_Sheet.pdf; NexusDeviceID: XC7A100T-3FGG484E; DatasheetVersion: v1.12; Mounting Technology: Surface Mount; PackageDescription: Wire-Bond Fine-Pitch BGA, Body 23 x 23 mm, 1.0 mm Pitch; PackageReference: FGG484; ComponentLink2Description: Package Specification; Code_JEDEC: MS-034-AAJ-1; ComponentLink2URL: http://www.xilinx.com/support/documentation/user_guides/ug475_7Series_Pkg_Pinout.pdf; ComponentLink3Description: DC and Switching Characteristics; Generic Part Number: XC7A100T; ComponentLink4Description: Package File; ComponentLink4URL: http://www.xilinx.com/support/packagefiles/a7packages/xc7a100tfgg484pkg.txt; ComponentLink1URL: http://www.xilinx.com/support/documentation/data_sheets/ds180_7Series_Overview.pdf; PartNumber: XC7A100T-3FGG484E; ComponentLink5URL: http://www.xilinx.com/support/documentation/user_guides/ug475_7Series_Pkg_Pinout.pdf; PackageVersion: Rev 1.8; ComponentLink5Description: Packaging and Pinout; ComponentLink1Description: Datasheet; CLBs (Max Distributed RAM Kb): 1188

## Sheet FPGA_SDRAM.SchDoc: =DocumentName
size A3; DocumentNumber: 1; Revision: 0; SheetNumber: 22; SheetTotal: 30
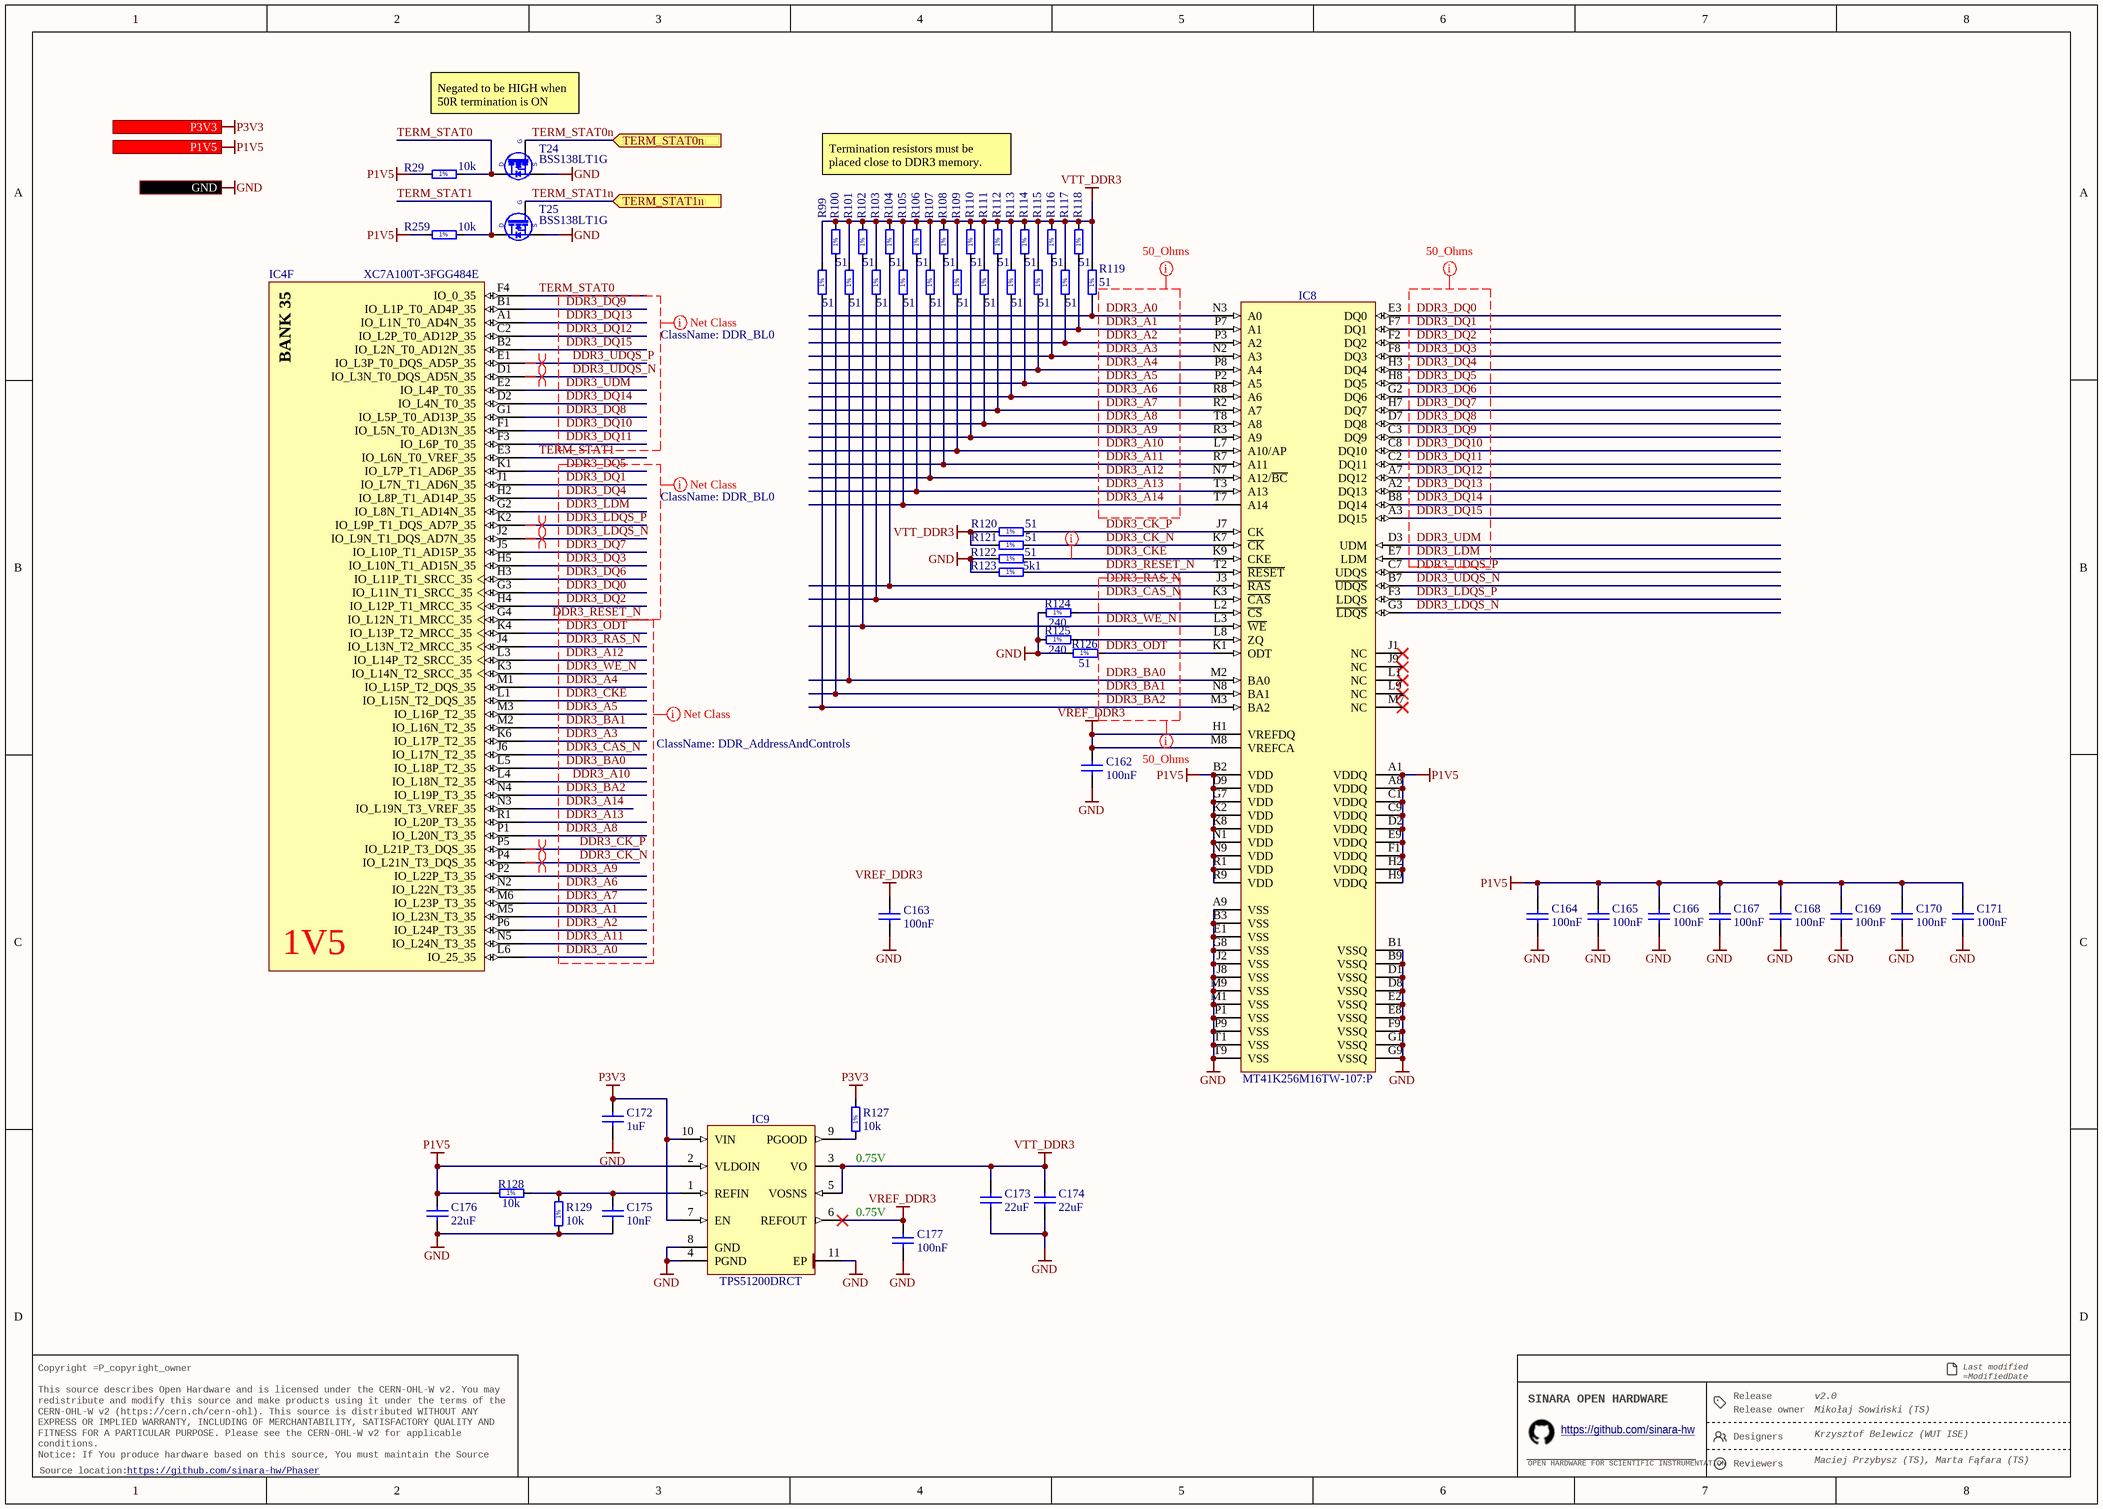
[diagram p17: FPGA_SDRAM.SchDoc]

### Parts
(Parts that share a designator on the sheet are numbered #1, #2 ... from top to bottom, then left to right.)
C162  100nF  [CAPC0603X33N]
C163  100nF  [CAPC0603X33N]
C164  100nF  [CAPC0603X33N]
C165  100nF  [CAPC0603X33N]
C166  100nF  [CAPC0603X33N]
C167  100nF  [CAPC0603X33N]
C168  100nF  [CAPC0603X33N]
C169  100nF  [CAPC0603X33N]
C170  100nF  [CAPC0603X33N]
C171  100nF  [CAPC0603X33N]
C172  1uF  [CAPC1005X55N]
C173  22uF  [CAPC1709X100N]
C174  22uF  [CAPC1709X100N]
C175  10nF  [CAPC1005X55N]
C176  22uF  [CAPC1709X100N]
C177  100nF  [CAPC0603X33N]
IC4#1  XC7A100T-3FGG484E  [FGG484]  (part F of 10)
IC8  MT41K256M16TW-107:P  [BGA96C80P9X16_800X1400X120]
IC9  TPS51200DRCT  [TEXAS_DRC (S-PVSON-N10)]
R29  10k  [RESC1005X40N]
R99  51  [RESC1005X40N]
R100  51  [RESC1005X40N]
R101  51  [RESC1005X40N]
R102  51  [RESC1005X40N]
R103  51  [RESC1005X40N]
R104  51  [RESC1005X40N]
R105  51  [RESC1005X40N]
R106  51  [RESC1005X40N]
R107  51  [RESC1005X40N]
R108  51  [RESC1005X40N]
R109  51  [RESC1005X40N]
R110  51  [RESC1005X40N]
R111  51  [RESC1005X40N]
R112  51  [RESC1005X40N]
R113  51  [RESC1005X40N]
R114  51  [RESC1005X40N]
R115  51  [RESC1005X40N]
R116  51  [RESC1005X40N]
R117  51  [RESC1005X40N]
R118  51  [RESC1005X40N]
R119  51  [RESC1005X40N]
R120  51  [RESC1005X40N]
R121  51  [RESC1005X40N]
R122  51  [RESC1005X40N]
R123  5k1  [RESC1005X40N]
R124  240  [RESC1005X40N]
R125  240  [RESC1005X40N]
R126  51  [RESC1005X40N]
R127  10k  [RESC1005X40N]
R128  10k  [RESC1005X40N]
R129  10k  [RESC1005X40N]
R259  10k  [RESC1005X40N]
T24  BSS138LT1G  [SOT95P240X110-3N]
T25  BSS138LT1G  [SOT95P240X110-3N]

### Ports
GND, P1V5 (in), P3V3 (in), TERM_STAT0n (in), TERM_STAT1n (in)

### Nets
GND: C162.1 C163.1 C164.1 C165.1 C166.1 C167.1 C168.1 C169.1 C170.1 C171.1 C172.1 C173.1 C174.1 C175.2 C176.1 C177.1 IC8.A9(VSS) IC8.B1(VSSQ) IC8.B3(VSS) IC8.B9(VSSQ) IC8.D1(VSSQ) IC8.D8(VSSQ) IC8.E1(VSS) IC8.E2(VSSQ) IC8.E8(VSSQ) IC8.F9(VSSQ) IC8.G1(VSSQ) IC8.G8(VSS) IC8.G9(VSSQ) IC8.J2(VSS) IC8.J8(VSS) IC8.M1(VSS) IC8.M9(VSS) IC8.P1(VSS) IC8.P9(VSS) IC8.T1(VSS) IC8.T9(VSS) IC9.4(PGND) IC9.8(GND) IC9.11(EP) R122.1 R123.1 R124.1 R125.1 R126.1 R129.1 T24.2(S) T25.2(S) ; port GND
P1V5: C164.2 C165.2 C166.2 C167.2 C168.2 C169.2 C170.2 C171.2 C176.2 IC8.A1(VDDQ) IC8.A8(VDDQ) IC8.B2(VDD) IC8.C1(VDDQ) IC8.C9(VDDQ) IC8.D2(VDDQ) IC8.D9(VDD) IC8.E9(VDDQ) IC8.F1(VDDQ) IC8.G7(VDD) IC8.H2(VDDQ) IC8.H9(VDDQ) IC8.K2(VDD) IC8.K8(VDD) IC8.N1(VDD) IC8.N9(VDD) IC8.R1(VDD) IC8.R9(VDD) IC9.2(VLDOIN) R29.1 R128.1 R259.1 ; port P1V5
P3V3: C172.2 IC9.7(EN) IC9.10(VIN) R127.2 ; port P3V3
VREF_DDR3: C162.2 C163.2 C177.2 IC8.H1(VREFDQ) IC8.M8(VREFCA) IC9.6(REFOUT)
VTT_DDR3: C173.2 C174.2 IC9.3(VO) IC9.5(VOSNS) R99.2 R100.2 R101.2 R102.2 R103.2 R104.2 R105.2 R106.2 R107.2 R108.2 R109.2 R110.2 R111.2 R112.2 R113.2 R114.2 R115.2 R116.2 R117.2 R118.2 R119.2 R120.1 R121.1
DDR3_A0: IC4#1.L6(IO_25_35) IC8.N3(A0) R119.1
DDR3_A1: IC4#1.M5(IO_L23N_T3_35) IC8.P7(A1) R118.1
DDR3_A2: IC4#1.P6(IO_L24P_T3_35) IC8.P3(A2) R117.1
DDR3_A3: IC4#1.K6(IO_L17P_T2_35) IC8.N2(A3) R116.1
DDR3_A4: IC4#1.M1(IO_L15P_T2_DQS_35) IC8.P8(A4) R115.1
DDR3_A5: IC4#1.M3(IO_L16P_T2_35) IC8.P2(A5) R114.1
DDR3_A6: IC4#1.N2(IO_L22N_T3_35) IC8.R8(A6) R113.1
DDR3_A7: IC4#1.M6(IO_L23P_T3_35) IC8.R2(A7) R112.1
DDR3_A8: IC4#1.P1(IO_L20N_T3_35) IC8.T8(A8) R111.1
DDR3_A9: IC4#1.P2(IO_L22P_T3_35) IC8.R3(A9) R110.1
DDR3_A10: IC4#1.L4(IO_L18N_T2_35) IC8.L7(A10/AP) R109.1
DDR3_A11: IC4#1.N5(IO_L24N_T3_35) IC8.R7(A11) R108.1
DDR3_A12: IC4#1.L3(IO_L14P_T2_SRCC_35) IC8.N7(A12/~{BC}) R107.1
DDR3_A13: IC4#1.R1(IO_L20P_T3_35) IC8.T3(A13) R106.1
DDR3_A14: IC4#1.N3(IO_L19N_T3_VREF_35) IC8.T7(A14) R105.1
DDR3_BA0: IC4#1.L5(IO_L18P_T2_35) IC8.M2(BA0) R101.1
DDR3_BA1: IC4#1.M2(IO_L16N_T2_35) IC8.N8(BA1) R100.1
DDR3_BA2: IC4#1.N4(IO_L19P_T3_35) IC8.M3(BA2) R99.1
DDR3_CAS_N: IC4#1.J6(IO_L17N_T2_35) IC8.K3(~{CAS}) R103.1
DDR3_CK_N: IC4#1.P4(IO_L21N_T3_DQS_35) IC8.K7(~{CK}) R121.2
DDR3_CK_P: IC4#1.P5(IO_L21P_T3_DQS_35) IC8.J7(CK) R120.2
DDR3_CKE: IC4#1.L1(IO_L15N_T2_DQS_35) IC8.K9(CKE) R122.2
DDR3_DQ0: IC4#1.G3(IO_L11N_T1_SRCC_35) IC8.E3(DQ0)
DDR3_DQ1: IC4#1.J1(IO_L7N_T1_AD6N_35) IC8.F7(DQ1)
DDR3_DQ2: IC4#1.H4(IO_L12P_T1_MRCC_35) IC8.F2(DQ2)
DDR3_DQ3: IC4#1.H5(IO_L10N_T1_AD15N_35) IC8.F8(DQ3)
DDR3_DQ4: IC4#1.H2(IO_L8P_T1_AD14P_35) IC8.H3(DQ4)
DDR3_DQ5: IC4#1.K1(IO_L7P_T1_AD6P_35) IC8.H8(DQ5)
DDR3_DQ6: IC4#1.H3(IO_L11P_T1_SRCC_35) IC8.G2(DQ6)
DDR3_DQ7: IC4#1.J5(IO_L10P_T1_AD15P_35) IC8.H7(DQ7)
DDR3_DQ8: IC4#1.G1(IO_L5P_T0_AD13P_35) IC8.D7(DQ8)
DDR3_DQ9: IC4#1.B1(IO_L1P_T0_AD4P_35) IC8.C3(DQ9)
DDR3_DQ10: IC4#1.F1(IO_L5N_T0_AD13N_35) IC8.C8(DQ10)
DDR3_DQ11: IC4#1.F3(IO_L6P_T0_35) IC8.C2(DQ11)
DDR3_DQ12: IC4#1.C2(IO_L2P_T0_AD12P_35) IC8.A7(DQ12)
DDR3_DQ13: IC4#1.A1(IO_L1N_T0_AD4N_35) IC8.A2(DQ13)
DDR3_DQ14: IC4#1.D2(IO_L4N_T0_35) IC8.B8(DQ14)
DDR3_DQ15: IC4#1.B2(IO_L2N_T0_AD12N_35) IC8.A3(DQ15)
DDR3_LDM: IC4#1.G2(IO_L8N_T1_AD14N_35) IC8.E7(LDM)
DDR3_LDQS_N: IC4#1.J2(IO_L9N_T1_DQS_AD7N_35) IC8.G3(~{LDQS})
DDR3_LDQS_P: IC4#1.K2(IO_L9P_T1_DQS_AD7P_35) IC8.F3(LDQS)
DDR3_ODT: IC4#1.K4(IO_L13P_T2_MRCC_35) IC8.K1(ODT) R126.2
DDR3_RAS_N: IC4#1.J4(IO_L13N_T2_MRCC_35) IC8.J3(~{RAS}) R104.1
DDR3_RESET_N: IC4#1.G4(IO_L12N_T1_MRCC_35) IC8.T2(~{RESET}) R123.2
DDR3_UDM: IC4#1.E2(IO_L4P_T0_35) IC8.D3(UDM)
DDR3_UDQS_N: IC4#1.D1(IO_L3N_T0_DQS_AD5N_35) IC8.B7(~{UDQS})
DDR3_UDQS_P: IC4#1.E1(IO_L3P_T0_DQS_AD5P_35) IC8.C7(UDQS)
DDR3_WE_N: IC4#1.K3(IO_L14N_T2_SRCC_35) IC8.L3(~{WE}) R102.1
TERM_STAT0: IC4#1.F4(IO_0_35) R29.2 T24.3(D)
TERM_STAT0n: T24.1(G) ; port TERM_STAT0n
TERM_STAT1: IC4#1.E3(IO_L6N_T0_VREF_35) R259.2 T25.3(D)
TERM_STAT1n: T25.1(G) ; port TERM_STAT1n
NetC175_1: C175.1 IC9.1(REFIN) R128.2 R129.2
NetIC8_L2: IC8.L2(~{CS}) R124.2
NetIC8_L8: IC8.L8(ZQ) R125.2
NetIC9_9: IC9.9(PGOOD) R127.1

Not connected (* = marked no-connect by the designer): IC8 J1(NC)* J9(NC)* L1(NC)* L9(NC)* M7(NC)*

### Layout directives
net class DDR_AddressAndControls: DDR3_A0, DDR3_A1, DDR3_A2, DDR3_A3, DDR3_A4, DDR3_A5, DDR3_A6, DDR3_A7, DDR3_A8, DDR3_A9, DDR3_A10, DDR3_A11, DDR3_A12, DDR3_A13, DDR3_A14, DDR3_BA0, DDR3_BA1, DDR3_BA2, DDR3_CAS_N, DDR3_CK_N, DDR3_CK_P, DDR3_CKE, DDR3_ODT, DDR3_RAS_N, DDR3_WE_N
net class DDR_BL0: DDR3_DQ0, DDR3_DQ1, DDR3_DQ2, DDR3_DQ3, DDR3_DQ4, DDR3_DQ5, DDR3_DQ6, DDR3_DQ7, DDR3_DQ8, DDR3_DQ9, DDR3_DQ10, DDR3_DQ11, DDR3_DQ12, DDR3_DQ13, DDR3_DQ14, DDR3_DQ15, DDR3_LDM, DDR3_LDQS_N, DDR3_LDQS_P, DDR3_UDM, DDR3_UDQS_N, DDR3_UDQS_P
differential pair; differential pair class Diff_100Ohm: DDR3_CK_N, DDR3_CK_P, DDR3_LDQS_N, DDR3_LDQS_P, DDR3_UDQS_N, DDR3_UDQS_P
net class 50_Ohms: DDR3_A0, DDR3_A1, DDR3_A2, DDR3_A3, DDR3_A4, DDR3_A5, DDR3_A6, DDR3_A7, DDR3_A8, DDR3_A9, DDR3_A10, DDR3_A11, DDR3_A12, DDR3_A13, DDR3_A14, DDR3_BA0, DDR3_BA1, DDR3_BA2, DDR3_CAS_N, DDR3_CKE, DDR3_DQ0, DDR3_DQ1, DDR3_DQ2, DDR3_DQ3, DDR3_DQ4, DDR3_DQ5, DDR3_DQ6, DDR3_DQ7, DDR3_DQ8, DDR3_DQ9, DDR3_DQ10, DDR3_DQ11, DDR3_DQ12, DDR3_DQ13, DDR3_DQ14, DDR3_DQ15, DDR3_LDM, DDR3_ODT, DDR3_RAS_N, DDR3_UDM, DDR3_WE_N

### Notes on the sheet
- Negated to be HIGH when 50R termination is ON
- Termination resistors must be placed close to DDR3 memory.
- 1V5
- (near R127) 0.75V
- (near C177) 0.75V
- Release
- Last modified =ModifiedDate
  Sheet =sheetnumber of =sheettotal · Size A3
- Copyright =P_copyright_owner
  This source describes Open Hardware and is licensed under the CERN-OHL-W v2. You may redistribute and modify this source and make products using it under the terms of the CERN-OHL-W v2 (https://cern.ch/cern-ohl). This source is distributed WITHOUT ANY EXPRESS OR IMPLIED WARRANTY, INCLUDING OF MERCHANTABILITY, SATISFACTORY QUALITY AND FITNESS FOR A PARTICULAR PURPOSE. Please see the CERN-OHL-W v2 for applicable conditions.
  Notice: If You produce hardware based on this source, You must maintain the Source Location visible on the product, its packaging or its documentation.
- SINARA OPEN HARDWARE
- OPEN HARDWARE FOR SCIENTIFIC INSTRUMENTATION
- https://github.com/sinara-hw
- Release owner
- Designers
- Reviewers
- Source location:
- (in symbol CMP-0364-00028-3, part F) BANK 35
- (in symbol R0402_5K1_1%_0.0625W_100PPM) 1%
- (in symbol R0402_10K_1%_0.0625W_100PPM) 1%
- (in symbol R0402_51R_1%_0.0625W_100PPM) 1%
- (in symbol R0402_240R_1%_0.0625W_100PPM) 1%

### Library data of the parts
C162-C171 C177 = CC0201_100NF_6.3V_10%_X5R: Non-polarised capacitor; Part Description: SMD Multilayer Chip Ceramic Capacitor; Manufacturer: GENERIC; Manufacturer1 Part Number: 02016D104KAT2A; Voltage: 6.3V; TC: X5R; Tolerance: ±10%; Part Number: CC0201_100NF_6.3V_10%_X5R; Component Kind: Standard; Component Type: Standard; Pin Count: 2; Value: 100nF; Status: Not Recommended; Manufacturer Part Number: CC0201_100NF_6.3V_10%_X5R; Case: 0201; Mounted: Yes; Socket: No; SMD: Yes; Sense: No; Manufacturer1 Example: AVX; Manufacturer1 ComponentHeight: 0.33mm; HelpURL: \\cern.ch\dfs\Applications\Altium\Datasheets\CC0201_X5R_AVX.pdf; Author: CERN DEM JLC
  C162-C171: CreateDate: 2007-12-03; LatestRevisionDate: 2007-12-03
  C177: CreateDate: 03.12.2007; LatestRevisionDate: 03.12.2007
C172 = CC0402_1UF_16V_10%_X5R: Non-polarised capacitor; Part Description: SMD Multilayer Chip Ceramic Capacitor; Manufacturer: GENERIC; Manufacturer1 Part Number: C1005X5R1C105KT; Voltage: 16V; TC: X5R; Tolerance: ±10%; Part Number: CC0402_1UF_16V_10%_X5R; Component Kind: Standard; Component Type: Standard; Pin Count: 2; Value: 1uF; Status: Preferred; Manufacturer Part Number: CC0402_1UF_16V_10%_X5R; Case: 0402; Mounted: Yes; Socket: No; SMD: Yes; Manufacturer1 Example: TDK; Manufacturer1 ComponentHeight: 0.55mm; HelpURL: \\cern.ch\dfs\Applications\Altium\Datasheets\CC0402_X5R_TDK_C.pdf; Author: CERN DEM JLC; CreateDate: 25.10.2012; LatestRevisionDate: 25.10.2012; Sense: No
C173 C174 C176 = CC0603_22UF_6.3V_20%_X5R: Non-polarised capacitor; Part Description: SMD Multilayer Chip Ceramic Capacitor; Manufacturer: GENERIC; Manufacturer1 Part Number: C1608X5R0J226M080AC; Voltage: 6.3V; TC: X5R; Tolerance: ±20%; Part Number: CC0603_22UF_6.3V_20%_X5R; Component Kind: Standard; Component Type: Standard; Pin Count: 2; Value: 22uF; Status: None; Manufacturer Part Number: CC0603_22UF_6.3V_20%_X5R; Case: 0603; Mounted: Yes; Socket: No; SMD: Yes; Manufacturer1 Example: TDK; Manufacturer1 ComponentHeight: 1mm; HelpURL: \\cern.ch\dfs\Applications\Altium\Datasheets\CC0603_X5R_TDK_C.pdf; Author: CERN DEM JLC; CreateDate: 16.12.2013; LatestRevisionDate: 13.09.2016; Sense: No
C175 = CC0402_10NF_50V_5%_X7R: Non-polarised capacitor; Part Description: SMD Multilayer Chip Ceramic Capacitor; Manufacturer: GENERIC; Manufacturer1 Part Number: C0402C103J5RAC; Voltage: 50V; TC: X7R; Tolerance: ±5%; Part Number: CC0402_10NF_50V_5%_X7R; Component Kind: Standard; Component Type: Standard; Pin Count: 2; Value: 10nF; Status: Preferred; Manufacturer Part Number: CC0402_10NF_50V_5%_X7R; Case: 0402; Mounted: Yes; Socket: No; SMD: Yes; Sense: No; Manufacturer1 Example: KEMET; Manufacturer1 ComponentHeight: 0.55mm; HelpURL: \\cern.ch\dfs\Applications\Altium\Datasheets\CC0402_X7R_KEMET.pdf; Author: CERN DEM BC; CreateDate: 15.07.2020; LatestRevisionDate: 15.07.2020
IC4#1 = CMP-0364-00028-3: as IC4#1 on sheet FPGA_Config; RoHS: Pb-Free; ComponentLink3URL: http://www.xilinx.com/support/documentation/data_sheets/ds181_Artix_7_Data_Sheet.pdf; NexusDeviceID: XC7A100T-3FGG484E; DatasheetVersion: v1.12; Mounting Technology: Surface Mount; PackageDescription: Wire-Bond Fine-Pitch BGA, Body 23 x 23 mm, 1.0 mm Pitch; PackageReference: FGG484; ComponentLink2Description: Package Specification; Code_JEDEC: MS-034-AAJ-1; ComponentLink2URL: http://www.xilinx.com/support/documentation/user_guides/ug475_7Series_Pkg_Pinout.pdf; ComponentLink3Description: DC and Switching Characteristics; Generic Part Number: XC7A100T; ComponentLink4Description: Package File; ComponentLink4URL: http://www.xilinx.com/support/packagefiles/a7packages/xc7a100tfgg484pkg.txt; ComponentLink1URL: http://www.xilinx.com/support/documentation/data_sheets/ds180_7Series_Overview.pdf; PartNumber: XC7A100T-3FGG484E; ComponentLink5URL: http://www.xilinx.com/support/documentation/user_guides/ug475_7Series_Pkg_Pinout.pdf; PackageVersion: Rev 1.8; ComponentLink5Description: Packaging and Pinout; ComponentLink1Description: Datasheet; CLBs (Max Distributed RAM Kb): 1188
IC8 = MT41K256M16TW-107:P: 32 Meg x 16 x 8 Banks DDR3L SDRAM; Part Description: +1.5V, 4Gb (32Meg x 16 x 8 banks) DDR3L SDRAM; Manufacturer: MICRON TECHNOLOGY; PressFit: No; Bonding: No; Part Number: MT41K256M16TW-107:P; Component Kind: Standard; Component Type: Standard; Device: MT41K256M16TW-107:P; PackageDescription: BGA 0.8mm, Pitch, Square 96 Pin, 9 Columns x 16 Rows, Body 14mm X 8mm X 1.2mm H; Manufacturer Part Number: MT41K256M16TW-107:P; Pin Count: 96; Case: BGA96; Mounted: Yes; Socket: No; SMD: Yes; Sense: No; ComponentHeight: 1.2mm; HelpURL: \\cern.ch\dfs\Applications\Altium\Datasheets\MT41K256M16TW-107-P.pdf; Author: CERN DEM MR; CreateDate: 2015-12-14; LatestRevisionDate: 2015-12-14
IC9 = TPS51200DRCT: Sink/Source DDR Termination Regulator; Part Description: 3.3V Sink/Source DDR Termination Regulator; Manufacturer: TEXAS INSTRUMENTS; PressFit: No; Bonding: No; Part Number: TPS51200DRCT; Component Kind: Standard; Component Type: Standard; Device: TPS51200DRCT; PackageDescription: SON, 0.50mm Pitch, 10-pin, 3.00mm W  X 3.00mm L X 1.00mm Height, (w/thermal tab 1.75 X 2.50 mm); Manufacturer Part Number: TPS51200DRCT; Pin Count: 11; Case: SON10; Mounted: Yes; Socket: No; SMD: Yes; Sense: No; ComponentHeight: 1mm; HelpURL: \\cern.ch\dfs\Applications\Altium\Datasheets\TPS51200DRCT.pdf; Author: CERN DEM JLC; CreateDate: 03.02.2010; LatestRevisionDate: 06.11.2013
R29 R259 = R0402_10K_1%_0.0625W_100PPM: Resistor - 1%; Part Description: General Purpose Thick Film Chip Resistor; Manufacturer: GENERIC; Manufacturer1 Part Number: 232270671003L; TC: ±100ppm/°C; Part Number: R0402_10K_1%_0.0625W_100PPM; Component Kind: Standard; Component Type: Standard; Pin Count: 2; Value: 10k; Status: Not recommended; Power: 0.0625W; Tolerance: ±1%; Manufacturer Part Number: R0402_10K_1%_0.0625W_100PPM; Case: 0402; Mounted: Yes; Sense: No; Socket: No; SMD: Yes; Manufacturer1 Example: YAGEO PHYCOMP; Manufacturer1 ComponentHeight: 0.4mm; HelpURL: \\cern.ch\dfs\Applications\Altium\Datasheets\R0402_Phycomp_RC0402.pdf; Author: CERN DEM JLC; CreateDate: 03.12.2007; LatestRevisionDate: 17.10.2012
R99-R121 = R0402_51R_1%_0.0625W_100PPM: Resistor - 1%; Part Description: General Purpose Thick Film Chip Resistor; Manufacturer: GENERIC; Manufacturer1 Part Number: 232270675109; TC: ±100ppm/°C; Table: Resistors SMD; Part Number: R0402_51R_1%_0.0625W_100PPM; Component Kind: Standard; Component Type: Standard; Pin Count: 2; Value: 51; Status: Not recommended; Power: 0.0625W; Tolerance: ±1%; Manufacturer Part Number: R0402_51R_1%_0.0625W_100PPM; Mounted: Yes; Socket: No; SMD: Yes; Manufacturer1 Example: PHYCOMP; Manufacturer1 ComponentHeight: 0.4mm; HelpURL: \\cern.ch\dfs\Applications\Altium\Datasheets\R0402_Phycomp_RC0402.pdf; Author: CERN DEM JLC; CreateDate: 03/12/2007; LatestRevisionDate: 13/03/2008
  R99-R118 R120 R121: Case: 0402
R122 R126 = R0402_51R_1%_0.0625W_100PPM: Resistor - 1%; Part Description: General Purpose Thick Film Chip Resistor; Manufacturer: GENERIC; Manufacturer1 Part Number: 232270675109L; TC: ±100ppm/°C; PressFit: No; Part Number: R0402_51R_1%_0.0625W_100PPM; Component Kind: Standard; Component Type: Standard; Pin Count: 2; Value: 51; Status: Not Recommended; Power: 0.0625W; Tolerance: ±1%; Manufacturer Part Number: R0402_51R_1%_0.0625W_100PPM; Case: 0402; Mounted: Yes; Sense: No; Socket: No; SMD: Yes; Manufacturer1 Example: YAGEO PHYCOMP; Manufacturer1 ComponentHeight: 0.4mm; HelpURL: \\cern.ch\dfs\Applications\Altium\Datasheets\R0402_Phycomp_RC0402.pdf; Author: CERN DEM JLC; CreateDate: 2007-12-03; LatestRevisionDate: 2012-10-17
R123 = R0402_5K1_1%_0.0625W_100PPM: Resistor - 1%; Part Description: General Purpose Thick Film Chip Resistor; Manufacturer: GENERIC; Manufacturer1 Part Number: 232270675102L; TC: ±100ppm/°C; PressFit: No; Part Number: R0402_5K1_1%_0.0625W_100PPM; Component Kind: Standard; Component Type: Standard; Pin Count: 2; Value: 5k1; Status: Not Recommended; Power: 0.0625W; Tolerance: ±1%; Manufacturer Part Number: R0402_5K1_1%_0.0625W_100PPM; Case: 0402; Mounted: Yes; Sense: No; Socket: No; SMD: Yes; Manufacturer1 Example: YAGEO PHYCOMP; Manufacturer1 ComponentHeight: 0.4mm; HelpURL: \\cern.ch\dfs\Applications\Altium\Datasheets\R0402_Phycomp_RC0402.pdf; Author: CERN DEM JLC; CreateDate: 03.12.2007; LatestRevisionDate: 17.10.2012
R124 R125 = R0402_240R_1%_0.0625W_100PPM: Resistor - 1%; Part Description: General Purpose Thick Film Chip Resistor; Manufacturer: GENERIC; Manufacturer1 Part Number: 232270672401L; TC: ±100ppm/°C; PressFit: No; Part Number: R0402_240R_1%_0.0625W_100PPM; Component Kind: Standard; Component Type: Standard; Pin Count: 2; Value: 240; Status: Not Recommended; Power: 0.0625W; Tolerance: ±1%; Manufacturer Part Number: R0402_240R_1%_0.0625W_100PPM; Case: 0402; Mounted: Yes; Sense: No; Socket: No; SMD: Yes; Manufacturer1 Example: YAGEO PHYCOMP; Manufacturer1 ComponentHeight: 0.4mm; HelpURL: \\cern.ch\dfs\Applications\Altium\Datasheets\R0402_Phycomp_RC0402.pdf; Author: CERN DEM JLC; CreateDate: 03.12.2007; LatestRevisionDate: 17.10.2012
R127-R129 = R0402_10K_1%_0.0625W_100PPM: as R94 on sheet FPGA_Config; Part Number: R0402_10K_1%_0.0625W_100PPM; Component Kind: Standard; Component Type: Standard; Pin Count: 2; Value: 10k; Status: Not Recommended; Power: 0.0625W; Tolerance: ±1%; Manufacturer Part Number: R0402_10K_1%_0.0625W_100PPM; Case: 0402; Mounted: Yes; Socket: No; SMD: Yes; Manufacturer1 Example: YAGEO PHYCOMP; Manufacturer1 ComponentHeight: 0.4mm; HelpURL: \\cern.ch\dfs\Applications\Altium\Datasheets\R0402_Phycomp_RC0402.pdf; Author: CERN DEM JLC; CreateDate: 03.12.2007; LatestRevisionDate: 17.10.2012; Sense: No
T24 T25 = BSS138LT1G: N-CHANNEL MOSFET WITH DIODE; Part Description: 50V, 200mA N-Channel Enhancement Mode Field-Effect Transistor; Manufacturer: ON SEMICONDUCTOR; PressFit: No; Bonding: No; Part Number: BSS138LT1G; Component Kind: Standard; Component Type: Standard; Device: BSS138LT1G; PackageDescription: SOT23, 0.95mm Pitch; 3 Pin, 1.40mm W X 3.00mm L X 1.10mm H body, IPC Medium Density; Manufacturer Part Number: BSS138L; Pin Count: 3; Case: SOT23-3; Mounted: Yes; Socket: No; SMD: Yes; Sense: No; ComponentHeight: 1.11mm; HelpURL: \\cern.ch\dfs\Applications\Altium\Datasheets\BSS138LT1G.pdf; Author: CERN DEM JLC; CreateDate: 23.03.2009; LatestRevisionDate: 25.05.2022